# Altium schematic sheet 04.Input_Output.SchDoc: 04.Input_Output
size A4; Revision: V1.4; SheetNumber: 4; SheetTotal: 4; Project: TC264
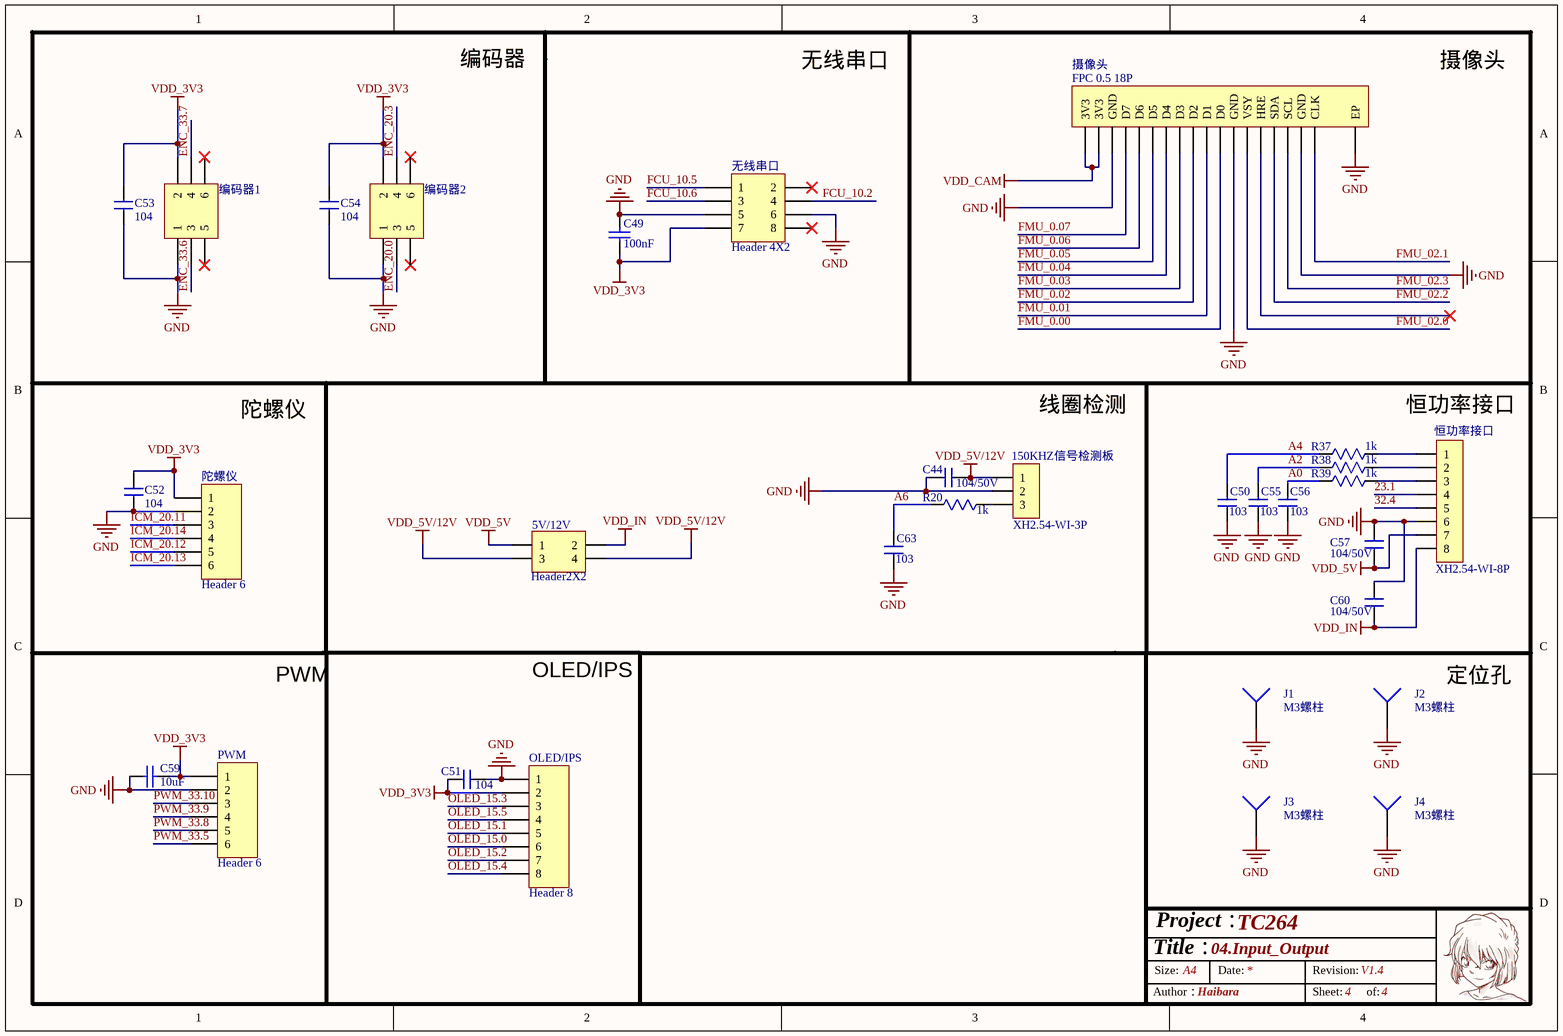
[diagram p0: 04.Input_Output.SchDoc]

## Parts
5V/12V  Header2X2  [HDR2.54-LI-2x2P]
150KHZ信号检测板  XH2.54-WI-3P  [XH2.54-WI-3P]
C44  104/50V  [C0805]
C49  100nF  [0603 电容 C3]
C50  103  [C0402]
C51  104  [C0603]
C52  104  [C0603]
C53  104  [C0603]
C54  104  [C0603]
C55  103  [C0402]
C56  103  [C0402]
C57  104/50V  [C0805]
C59  10UF  [0603 电容 C3]
C60  104/50V  [C0805]
C63  103  [C0402]
J1  M3螺柱  [MTGP720H320V6P - duplicate]
J2  M3螺柱  [MTGP720H320V6P - duplicate]
J3  M3螺柱  [MTGP720H320V6P - duplicate]
J4  M3螺柱  [MTGP720H320V6P - duplicate]
OLED/IPS  Header 8  [HDR2.54-LI-8P]
PWM  Header 6  [MX 1.25-WS-6P]
R20  1k  [R0402]
R37  1k  [R0402]
R38  1k  [R0402]
R39  1k  [R0402]
恒功率接口  XH2.54-WI-8P  [XH2.54-WI-8P]
摄像头  FPC 0.5 18P  [FPC0.5 2H-WS-18P]
无线串口  Header 4X2  [2.54mm 4P*2排母]
编码器1  Header 3X2  [DC-2.54-L-Z-6P]  (value not drawn)
编码器2  Header 3X2  [DC-2.54-L-Z-6P]  (value not drawn)
陀螺仪  Header 6  [MX 1.25-WS-6P]

## Nets
GND: 150KHZ信号检测板.2 C44.1 C49.1 C50.1 C51.2 C52.1 C53.1 C54.1 C55.1 C56.1 C57.2 C59.1 C60.2 C63.1 J1.1 J2.1 J3.1 J4.1 OLED/IPS.1 PWM.2 恒功率接口.6 摄像头.0(EP) 摄像头.3(GND) 摄像头.12(GND) 摄像头.17(GND) 无线串口.5 无线串口.6 编码器1.1 编码器2.1 陀螺仪.2
VDD_3V3: C49.2 C51.1 C52.2 C53.2 C54.2 C59.2 OLED/IPS.2 PWM.1 无线串口.7 编码器1.2 编码器2.2 陀螺仪.1
VDD_5V: 5V/12V.1 C57.1 恒功率接口.7
VDD_5V/12V: 5V/12V.3 5V/12V.4 150KHZ信号检测板.1 C44.2
VDD_CAM: 摄像头.1(3V3) 摄像头.2(3V3)
VDD_IN: 5V/12V.2 C60.1 恒功率接口.8
23.1: 恒功率接口.4
32.4: 恒功率接口.5
A0: C56.2 R39.2
A2: C55.2 R38.2
A4: C50.2 R37.2
A6: C63.2 R20.2
ENC_20.0: 编码器2.3
ENC_20.3: 编码器2.4
ENC_33.6: 编码器1.3
ENC_33.7: 编码器1.4
FCU_10.2: 无线串口.4
FCU_10.5: 无线串口.1
FCU_10.6: 无线串口.3
FMU_0.00: 摄像头.11(D0)
FMU_0.01: 摄像头.10(D1)
FMU_0.02: 摄像头.9(D2)
FMU_0.03: 摄像头.8(D3)
FMU_0.04: 摄像头.7(D4)
FMU_0.05: 摄像头.6(D5)
FMU_0.06: 摄像头.5(D6)
FMU_0.07: 摄像头.4(D7)
FMU_02.0: 摄像头.13(VSY)
FMU_02.1: 摄像头.18(CLK)
FMU_02.2: 摄像头.15(SDA)
FMU_02.3: 摄像头.16(SCL)
ICM_20.11: 陀螺仪.3
ICM_20.12: 陀螺仪.5
ICM_20.13: 陀螺仪.6
ICM_20.14: 陀螺仪.4
OLED_15.0: OLED/IPS.6
OLED_15.1: OLED/IPS.5
OLED_15.2: OLED/IPS.7
OLED_15.3: OLED/IPS.3
OLED_15.4: OLED/IPS.8
OLED_15.5: OLED/IPS.4
PWM_33.5: PWM.6
PWM_33.8: PWM.5
PWM_33.9: PWM.4
PWM_33.10: PWM.3
Net150KHZ信号检测板_3: 150KHZ信号检测板.3 R20.1
NetR37_1: R37.1 恒功率接口.1
NetR38_1: R38.1 恒功率接口.2
NetR39_1: R39.1 恒功率接口.3

Not connected (* = marked no-connect by the designer): 摄像头 14(HRE)*; 无线串口 2* 8*; 编码器1 5* 6*; 编码器2 5* 6*

## Notes on the sheet
- 编码器
- 无线串口
- 摄像头
- 陀螺仪
- 线圈检测
- 恒功率接口
- PWM
- OLED/IPS
- 定位孔
- Title：
- Size:
- Project：
- A4
- Date:
- Revision:
- Author：
- Haibara
- Sheet:
- of:

## Library data of the parts
5V/12V = Header 2X2: 2*2P接插件; 版权归属: 封装库来自淘宝 ID：黄晶宝石; BOM名称: 2*2P接插件; 学习资源: https://shop463601444.taobao.com
150KHZ信号检测板 = Header 3: 3P接插件; 版权归属: 封装库来自淘宝 ID：黄晶宝石; BOM名称: 3P接插件; 学习资源: https://shop463601444.taobao.com
C44 C50-C57 C60 C63 = 电容
C49 C59 = Cap: Capacitor; Published: 8-Jun-2000; LatestRevisionDate: 17-Jul-2002; LatestRevisionNote: Re-released for DXP Platform.; PackageReference: RAD-0.3; Publisher: Altium Limited; PackageDescription: Radial Cap, Thru-Hole; 2 Leads; 0.3 in Pin Spacing
  C59: Value: 10uF
J1-J4 = Socket: LatestRevisionDate: 17-Jul-2002; LatestRevisionNote: Re-released for DXP Platform.; Publisher: Altium Limited
OLED/IPS = Header 8: Header, 8-Pin; LatestRevisionDate: 17-Jul-2002; LatestRevisionNote: Re-released for DXP Platform.; Publisher: Altium Limited
PWM 陀螺仪 = Header 6: Header, 6-Pin; LatestRevisionDate: 17-Jul-2002; LatestRevisionNote: Re-released for DXP Platform.; Publisher: Altium Limited
R20 R37-R39 = 电阻
恒功率接口 = Header 8: 8P接插件; 版权归属: 封装库来自淘宝 ID：黄晶宝石; BOM名称: 8P接插件; 学习资源: https://shop463601444.taobao.com
摄像头 = 18P Cam: Header, 25-Pin; LatestRevisionDate: 17-Jul-2002; LatestRevisionNote: Re-released for DXP Platform.; Publisher: Altium Limited
无线串口 = Header 4X2: Header, 4-Pin, Dual row; LatestRevisionDate: 17-Jul-2002; LatestRevisionNote: Re-released for DXP Platform.; Publisher: Altium Limited
编码器1 编码器2 = Header 3X2: Header, 3-Pin, Dual row; LatestRevisionDate: 17-Jul-2002; LatestRevisionNote: Re-released for DXP Platform.; Publisher: Altium Limited